# EasyEDA Pro project ProPrj_国赛底层板子_2026-05-31.epro, schematic Schematic1

## Sheets
1 P1: Board Name: Board1; Create Date: 2025-09-03; Page Name: P1; Project Name: 连接板; Schematic Name: Schematic1; Update Date: 2025-09-16; Company: 嘉立创EDA; Page Size: A4; Version: V1.0
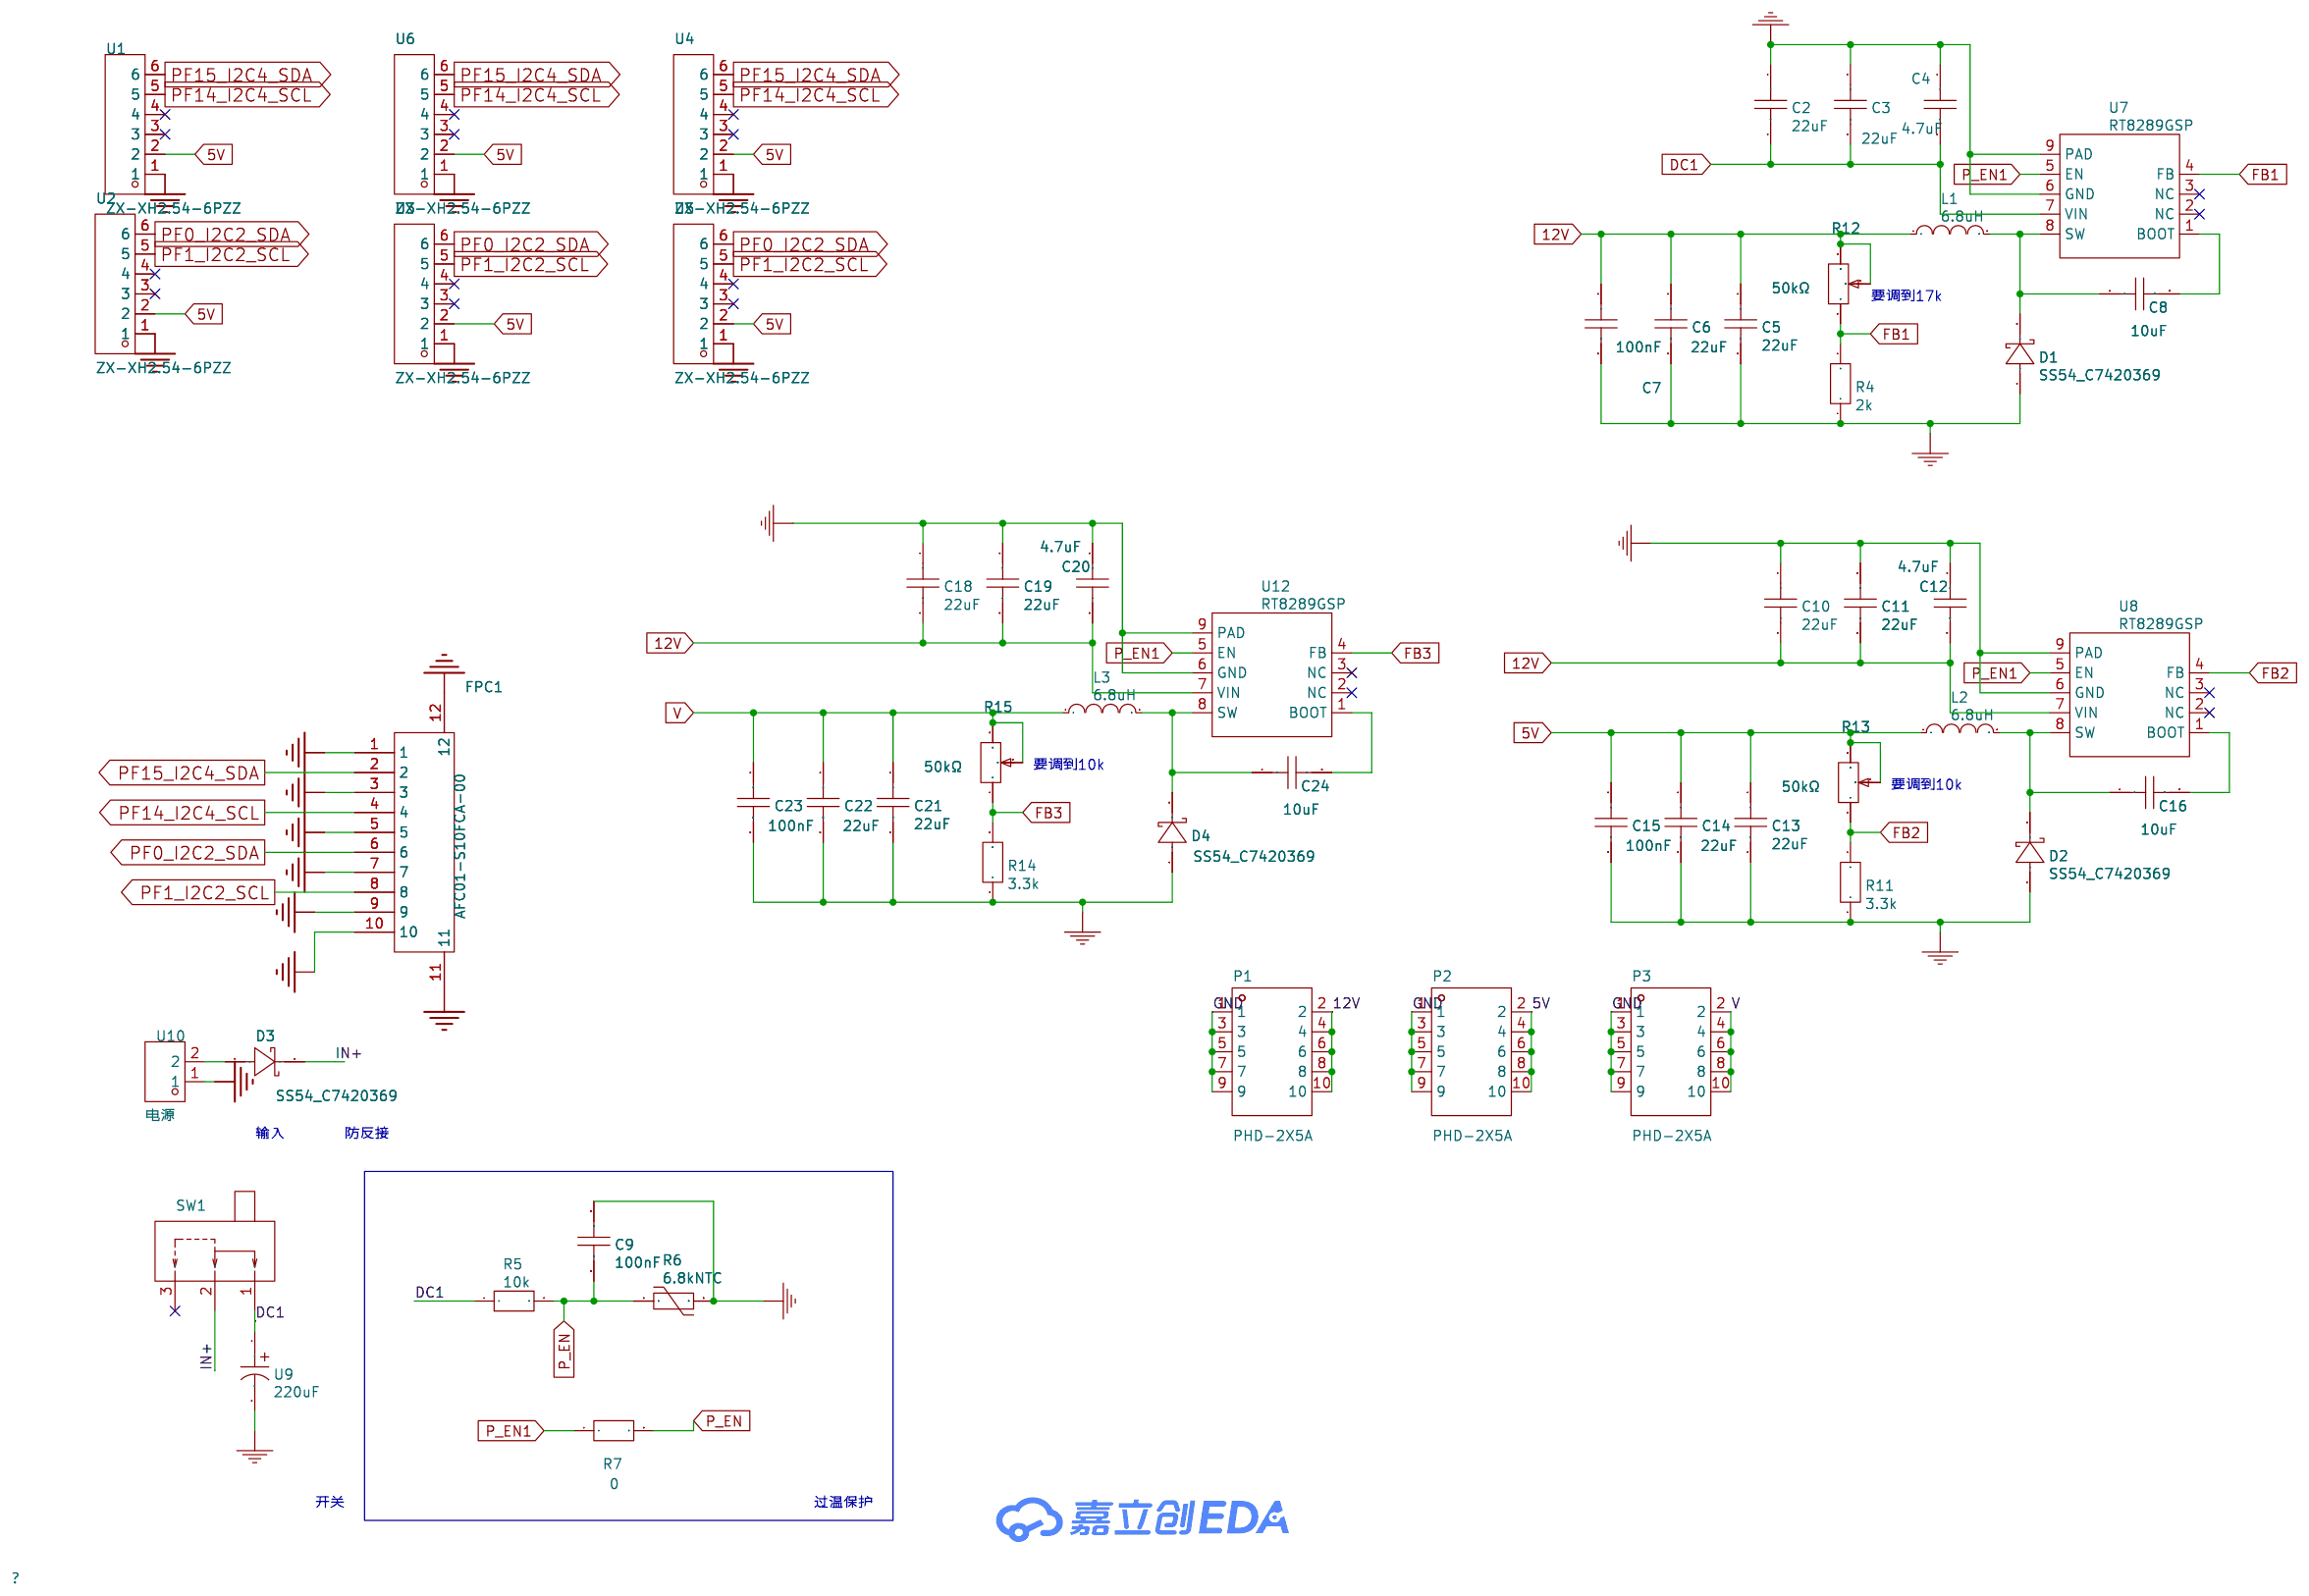
[diagram p0: P1]
2 P2: Page Name: P2; Update Date: 2025-09-03
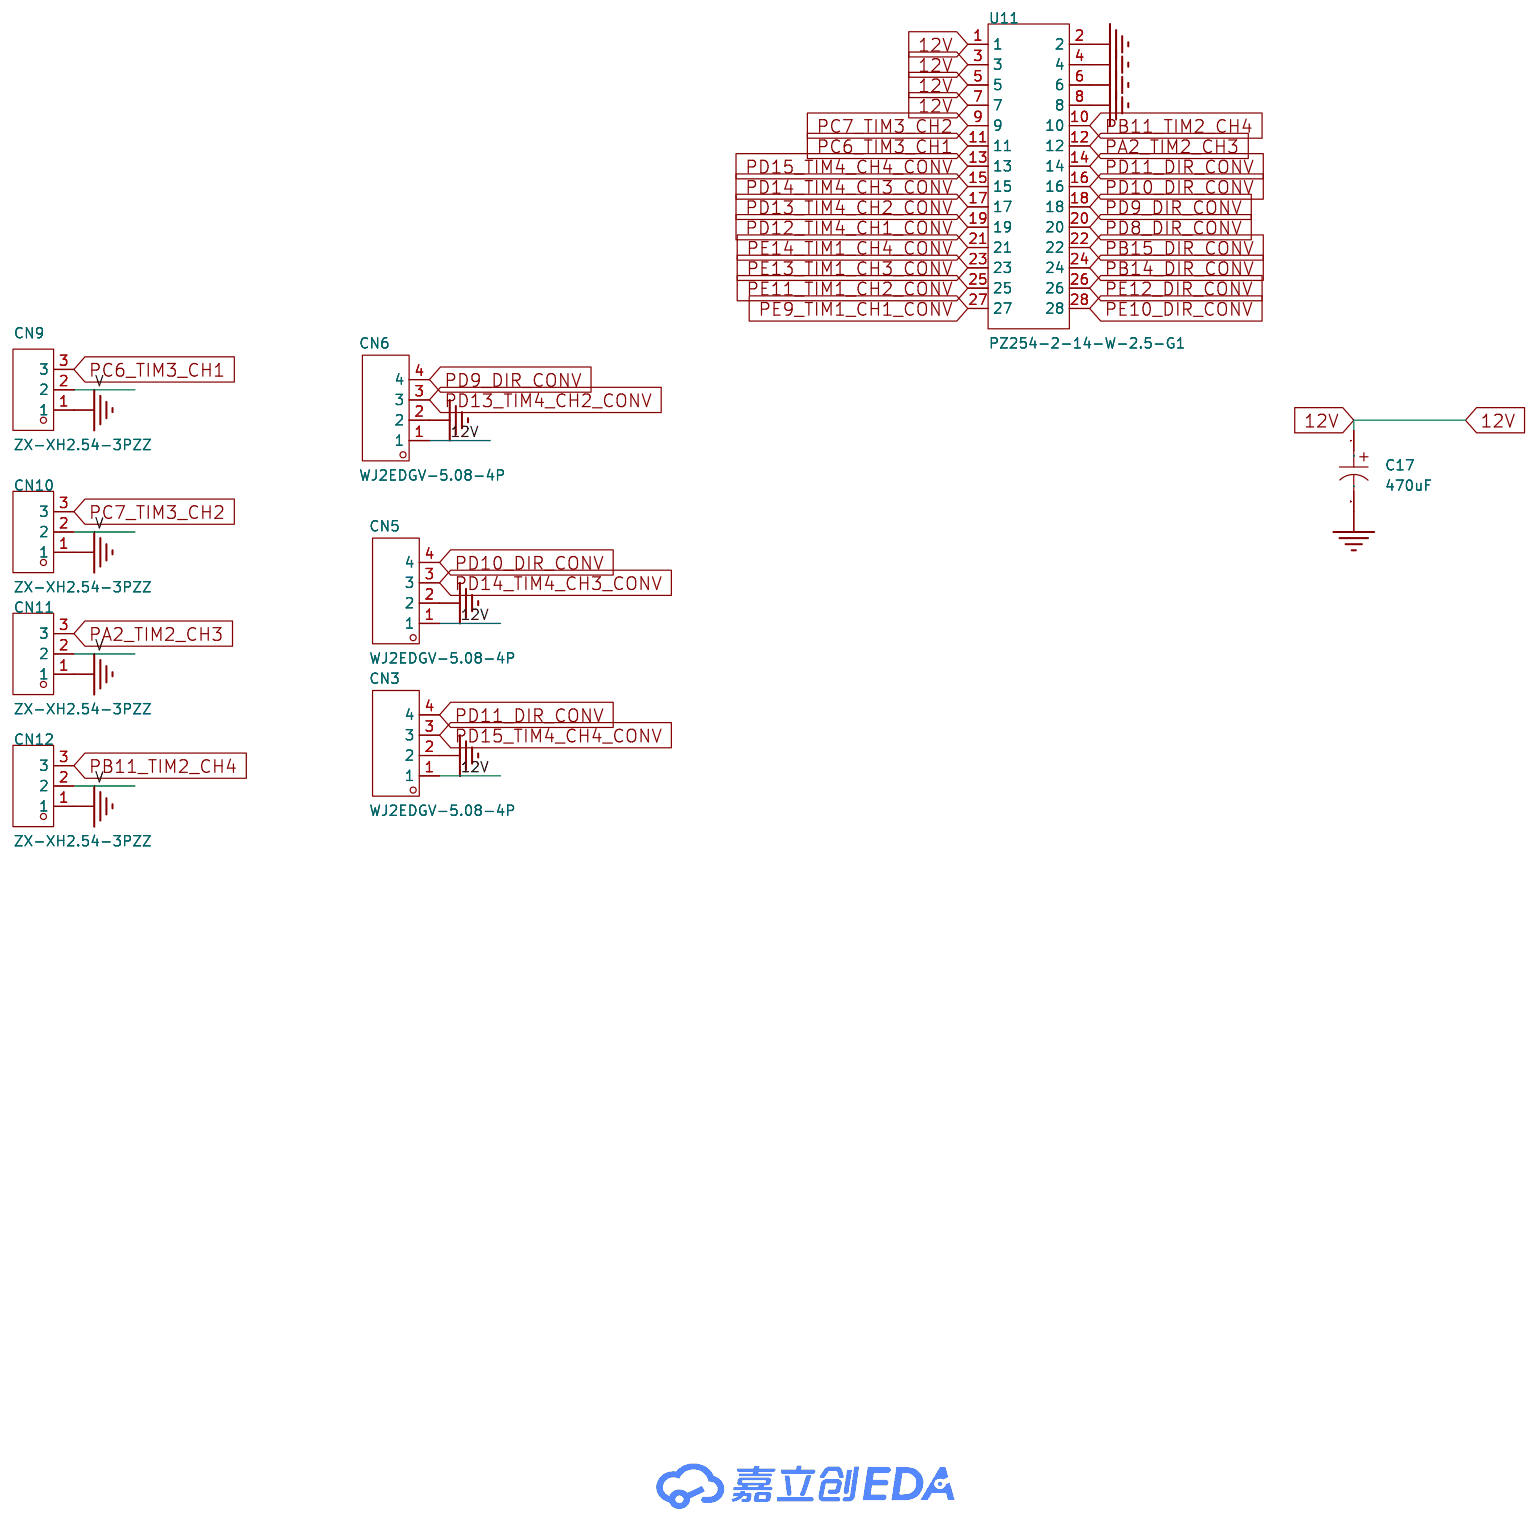
[diagram p1: P2]

## Parts
sheet P1
C2  22uF  [C0805]
C3  22uF  [C0805]
C4  4.7uF  [C0805]
C5  22uF  [C0805]
C6  22uF  [C0805]
C7  100nF  [C0805]
C8  10uF  [C0805]
C9  100nF  [C0805]
C10  22uF  [C0805]
C11  22uF  [C0805]
C12  4.7uF  [C0805]
C13  22uF  [C0805]
C14  22uF  [C0805]
C15  100nF  [C0805]
C16  10uF  [C0805]
C18  22uF  [C0805]
C19  22uF  [C0805]
C20  4.7uF  [C0805]
C21  22uF  [C0805]
C22  22uF  [C0805]
C23  100nF  [C0805]
C24  10uF  [C0805]
D1  SS54_C7420369  [SMA_L4.3-W2.6-LS5.0-FD]
D2  SS54_C7420369  [SMA_L4.3-W2.6-LS5.0-FD]
D3  SS54_C7420369  [SMA_L4.3-W2.6-LS5.0-FD]
D4  SS54_C7420369  [SMA_L4.3-W2.6-LS5.0-FD]
FPC1  AFC01-S10FCA-00  [FPC-SMD_P0.5-10P_FGS-XJ-H2.0]
L1  6.8uH  [IND-SMD_L7.0-W6.6]
L2  6.8uH  [IND-SMD_L7.0-W6.6]
L3  6.8uH  [IND-SMD_L7.0-W6.6]
P1  PHD-2X5A  [CONN-TH_10P-P2.00_PHD2.0MM-2X5]
P2  PHD-2X5A  [CONN-TH_10P-P2.00_PHD2.0MM-2X5]
P3  PHD-2X5A  [CONN-TH_10P-P2.00_PHD2.0MM-2X5]
R4  2k  [R0805]
R5  10k  [R0805]
R6  6.8kNTC  [R0805]
R7  0  [R0805]
R11  3.3k  [R0805]
R12  50kΩ  [RES-ADJ-TH_3296W]
R13  50kΩ  [RES-ADJ-TH_3296W]
R14  3.3k  [R0805]
R15  50kΩ  [RES-ADJ-TH_3296W]
SW1  KH-SS12D10-G9-3.5  [SW-TH_KH-SS12D10-G9-3.5]
U1  ZX-XH2.54-6PZZ  [CONN-TH_6P-P2.50_ZX-XH2.54-6PZZ]
U2  ZX-XH2.54-6PZZ  [CONN-TH_6P-P2.50_ZX-XH2.54-6PZZ]
U3  ZX-XH2.54-6PZZ  [CONN-TH_6P-P2.50_ZX-XH2.54-6PZZ]
U4  ZX-XH2.54-6PZZ  [CONN-TH_6P-P2.50_ZX-XH2.54-6PZZ]
U5  ZX-XH2.54-6PZZ  [CONN-TH_6P-P2.50_ZX-XH2.54-6PZZ]
U6  ZX-XH2.54-6PZZ  [CONN-TH_6P-P2.50_ZX-XH2.54-6PZZ]
U7  RT8289GSP  [SOIC-8_L5.0-W4.0-P1.27-LS6.0-BL-EP2.0]
U8  RT8289GSP  [SOIC-8_L5.0-W4.0-P1.27-LS6.0-BL-EP2.0]
U9  220uF  [CAP-SMD_BD6.3-L6.5-W6.5-LS7.2-FD]
U10  电源  [CONN-TH_P5.00_KF301-5.0-2P]
U12  RT8289GSP  [SOIC-8_L5.0-W4.0-P1.27-LS6.0-BL-EP2.0]
sheet P2
C17  470uF  [CAP-TH_BD8.0-P3.50-D0.5-FD]
CN3  WJ2EDGV-5.08-4P  [CONN-TH_4P-P5.08_WJ2EDGV-5.08-4P]
CN5  WJ2EDGV-5.08-4P  [CONN-TH_4P-P5.08_WJ2EDGV-5.08-4P]
CN6  WJ2EDGV-5.08-4P  [CONN-TH_4P-P5.08_WJ2EDGV-5.08-4P]
CN9  ZX-XH2.54-3PZZ  [CONN-TH_3P-P2.54_2501S-3P]
CN10  ZX-XH2.54-3PZZ  [CONN-TH_3P-P2.54_2501S-3P]
CN11  ZX-XH2.54-3PZZ  [CONN-TH_3P-P2.54_2501S-3P]
CN12  ZX-XH2.54-3PZZ  [CONN-TH_3P-P2.54_2501S-3P]
U11  PZ254-2-14-W-2.5-G1  [HDR-TH_28P-P2.54-H-M-R2-C14-S2.54]

## Library data of the parts
C2 C3 C5 C6 C10 C11 C13 C14 C18 C19 C21 C22 = 22uF_1: nameAlias: Value(F); Contributor: LCEDA_Lib; spicePre: C; spiceSymbolName: C_RAD-0.1_US
C4 C12 C20 = 4.7uF_1: nameAlias: Value(F); Contributor: LCEDA_Lib; spicePre: C; spiceSymbolName: C_RAD-0.1_US
C7 C9 C15 C23 = 100nF_1: nameAlias: Value(F); Contributor: LCEDA_Lib; spicePre: C; spiceSymbolName: C_RAD-0.1_US
C8 C16 C24 = 10uF_1: nameAlias: Value(F); Contributor: LCEDA_Lib; spicePre: C; spiceSymbolName: C_RAD-0.1_US
D1-D4 = SS54_C7420369_1: Supplier: LCSC; Supplier Part: C7420369; Manufacturer: 宏迦橙; Manufacturer Part: SS54; JLCPCB Part Class: Extended Part; Contributor: lcsc; spicePre: D
FPC1 = AFC01-S10FCA-00: 锁定特性:翻盖式;触点类型:下接;触点数量:10P;间距:0.5mm;安装类型:卧贴;; LCSC Part Name: 间距:0.5mm P数:10P 翻盖式 下接; Supplier Part: C262659; Manufacturer: JS(钜硕电子); Supplier Footprint: SMD,P=0.5mm,卧贴; JLCPCB Part Class: 扩展库; Datasheet: https://atta.szlcsc.com/upload/public/pdf/source/20190816/C413942_2A72D1AC756EAE17EEDF756A339D4500.pdf; Supplier: LCSC; Locking Feature: 翻盖式; Contact Type: 下接; Number of Contacts: 10P; Pitch: 0.5mm; Mounting Type: 卧贴; FFC, FCB Thickness: 0.3mm; Height Above Board: 2mm
L1-L3 = 6.8uH_1: Supplier: LCSC; Manufacturer: cjiang(长江微电); Manufacturer Part: FXL0630-6R8-M; Supplier Part: C167221; JLCPCB Part Class: Extended Part; nameAlias: Value; Contributor: LCSC; spicePre: L; spiceSymbolName: FXL0630-6R8-M
P1-P3 = PHD-2X5A: 参考系列:PHD;间距:2mm;插针结构:2x5P;排数:2;每排PIN数:5;行距:2mm;安装方式:-;触头材质:磷青铜;; LCSC Part Name: PHD2.0mm-2X5,10P，脚距2.0mm双排直针针座; Supplier Part: C49123; Manufacturer: BOOMELE(博穆精密); Supplier Footprint: 插件,P=2mm; JLCPCB Part Class: Extended Part; Datasheet: https://atta.szlcsc.com/upload/public/pdf/source/20151126/1457707588189.pdf; Supplier: LCSC; Reference Series: PHD; Pitch: 2mm; Pins Structure: 2x5P; Number of Rows: 2; Number of PINs Per Row: 5; Row Spacing: 2mm; Contact Material: 磷青铜
R4 R11 R14 = 3.3k_1: nameAlias: Value(Ω); Contributor: LCEDA_Lib; spicePre: R; spiceSymbolName: R_AXIAL-0.3_EU
R5 = 10k_2: nameAlias: Value(Ω); Contributor: LCEDA_Lib; spicePre: R; spiceSymbolName: R_AXIAL-0.3_EU
R6 = 6.8kNTC_1: Supplier: LCSC; Supplier Part: C338640; Manufacturer: FH(风华); Manufacturer Part: CMFB682J3950HANT; JLCPCB Part Class: Extended Part; nameAlias: Value; Contributor: LCSC; spicePre: R; spiceSymbolName: CMFB682J3950HANT
R7 = 0_1: nameAlias: Value(Ω); Contributor: LCEDA_Lib; spicePre: R; spiceSymbolName: R_AXIAL-0.3_EU
R12 R13 R15 = 3296W-1-104-8mm: 阻值:100kΩ;精度:±10%;; LCSC Part Name: 100kΩ ±10%; Supplier Part: C330435; Manufacturer: BOCHEN(博晨); Supplier Footprint: 插件; JLCPCB Part Class: 扩展库; Datasheet: https://atta.szlcsc.com/upload/public/pdf/source/20181127/C330435_7F54C1F28E27466BE6653300BC6FB0B7.pdf; Supplier: LCSC; Tolerance: ±10%
SW1 = KH-SS12D10-G9-3.5_1: Supplier: LCSC; Supplier Part: C5274458; Manufacturer: kinghelm(金航标); JLCPCB Part Class: Extended Part; Contributor: lcsc; spicePre: S
U1-U6 = ZX-XH2.54-6PZZ: 插针结构:1x6P;间距:2.5mm;安装方式:直插;参考系列:XH;总PIN数:6P;排数:1;每排PIN数:6;行距:-;额定电流:3A;触头材质:黄铜;触头镀层:锡;工作温度:-25℃~+85℃;; LCSC Part Name: 1x6P 间距:2.5mm 直插 系列:XH; Supplier Part: C7429636; Manufacturer: Megastar(兆星); Supplier Footprint: 插件,P=2.5mm; JLCPCB Part Class: 扩展库; Datasheet: https://atta.szlcsc.com/upload/public/pdf/source/20230619/1243AD0A516E39CD3D274D8985780568.pdf; Supplier: LCSC; Pins Structure: 1x6P; Pitch: 2.5mm; Mounting Type: 直插; Reference Series: XH; Number of Pins: 6P; Number of Rows: 1; Number of PINs Per Row: 6; Current Rating: 3A; Contact Material: 黄铜; Contact Plating: 锡; Operating Temperature: -25℃~+85℃; Voltage Rating: 250V; Plastic Material: PA66; Flame Retardant Rating: UL94V-0; Color: 白色; Z-Height of the Board: 7mm; X-Length of Bottom Edge on Board (Spacing Line): 17.5mm; Y-Width of Bottom Edge on Board: 5.9mm
U7 U8 U12 = RT8289GSP_1: Supplier: LCSC; Manufacturer: RICHTEK(立锜); Supplier Part: C39202; JLCPCB Part Class: Extended Part; spicePre: U
U9 = 220uF_1: Supplier: LCSC; Supplier Part: C22383611; Manufacturer: ACMECON(鼎容); Manufacturer Part: GVS1A227M0604CN; JLCPCB Part Class: Extended Part; nameAlias: Value; Contributor: lcsc; spicePre: U; spiceSymbolName: GVS1A227M0604CN
U10 = KF301-5.0-2P: 结构:1x2P;间距:5mm;颜色:蓝色;安装方式:直插;额定电流:17A;额定电压:250V;排数:1;线规 - AWG:14~22;线规 - 平方毫米:1.5;每排PIN数:2;工作温度范围:-30℃~+120℃;; LCSC Part Name: 5mm 1x2P 排数:1 每排P数:2 直插; Supplier Part: C474881; Manufacturer: KEFA(科发); Supplier Footprint: 插件,P=5mm; JLCPCB Part Class: 扩展库; Datasheet: https://atta.szlcsc.com/upload/public/pdf/source/20230317/03A5B5FC229D6F9225E8F51DA1A4E80A.pdf; Supplier: LCSC; Structure: 1x2P; Pitch: 5mm; Color: 蓝色; Mounting Style: 直插; Current Rating (Max): 17A; Voltage Rating (Max): 250V; Number of Pins: 2P; Number of Rows: 1; Wire Gauge - AWG: 14~22; Wire Gauge - mm2: 1.5; Number of PINs Per Row: 2; Operating Temperature Range: -30℃~+120℃
C17 = ERG35V470M8X16: 容值:470uF;精度:±20%;额定电压:35V;纹波电流:1.05A@100kHz;等效串联电阻(ESR):70mΩ@100kHz;; LCSC Part Name: 470uF ±20% 35V; Supplier Part: C48935388; Manufacturer: 捷而瑞; Supplier Footprint: 插件,D8xL16mm; JLCPCB Part Class: 扩展库; Datasheet: https://atta.szlcsc.com/upload/public/pdf/source/20250526/717B4C76834FE5C4A331D19A222D031C.pdf; Supplier: LCSC; Tolerance: ±20%; Voltage Rating: 35V; Ripple Current: 1.05A@100kHz; Equivalent Series Resistance(ESR): 70mΩ@100kHz; Pin Spacing: 3.5mm; Diameter: 8mm; Height - Seated (Max): 16mm; Lifetime: 2000hrs@105℃; Operating Temperature: -40℃~+105℃
CN3 CN5 CN6 = WJ2EDGV-5.08-4P: 连接器类型:板端/插座-开口;固定方式:-;结构:1x4P;间距:5.08mm;颜色:绿色;安装方式:直针;排数:1;每排PIN数:4;额定电流:20A;额定电压:450V;线规 - AWG:-;线规 - 平方毫米:-;触头材质:黄铜;触头镀层:锡;工作温度范围:-40℃~+105℃;焊接温度(最大值):-;; LCSC Part Name: 1x4P 5.08mm 排数:1 每排P数:4; Supplier Part: C8429; Manufacturer: KANGNEX(康奈克斯电气); Supplier Footprint: 插件,P=5.08mm; JLCPCB Part Class: 扩展库; Datasheet: https://atta.szlcsc.com/upload/public/pdf/source/20191225/C8429_2B66D25DFDD07B102A2AAB9ACF72222E.pdf; Supplier: LCSC; Connector Type: 板端/插座-开口; Structure: 1x4P; Pitch: 5.08mm; Color: 绿色; Mounting Style: 直针; Number of Pins: 4P; Number of Rows: 1; Number of PINs Per Row: 4; Current Rating (Max): 20A; Voltage Rating (Max): 450V; Contact Material: 黄铜; Contact Plating: 锡; Operating Temperature Range: -40℃~+105℃
CN9-CN12 = ZX-XH2.54-3PZZ: 插针结构:1x3P;间距:2.5mm;安装方式:直插;参考系列:XH;总PIN数:3P;排数:1;每排PIN数:3;行距:-;额定电流:3A;触头材质:黄铜;触头镀层:锡;工作温度:-25℃~+85℃;; LCSC Part Name: 1x3P 间距:2.5mm 直插 系列:XH; Supplier Part: C7429633; Manufacturer: Megastar(兆星); Supplier Footprint: 插件,P=2.5mm; JLCPCB Part Class: 扩展库; Datasheet: https://atta.szlcsc.com/upload/public/pdf/source/20230619/AE17037A2CFDBE8D9CBA775D61AD0A84.pdf; Supplier: LCSC; Pins Structure: 1x3P; Pitch: 2.5mm; Mounting Type: 直插; Reference Series: XH; Number of Pins: 3P; Number of Rows: 1; Number of PINs Per Row: 3; Current Rating: 3A; Contact Material: 黄铜; Contact Plating: 锡; Operating Temperature: -25℃~+85℃; Voltage Rating: 250V; Plastic Material: PA66; Flame Retardant Rating: UL94V-0; Color: 白色; Z-Height of the Board: 7mm; X-Length of Bottom Edge on Board (Spacing Line): 10mm; Y-Width of Bottom Edge on Board: 5.9mm
U11 = PZ254-2-14-W-2.5-G1: 插针结构:2x14P;间距:2.54mm;行距:2.54mm;圆针/方针:方针;安装方式:弯插;排数:双排;总PIN位数:28P;额定电流:3A;配合针长度:6mm;塑高:2.5mm;端接针长度:-;工作温度:-40℃~+105℃;颜色:黑色;; LCSC Part Name: 2x14P 间距:2.54mm 方针 弯插; Supplier Part: C18198028; Manufacturer: HCTL(华灿天禄); Supplier Footprint: 弯插,P=2.54mm; JLCPCB Part Class: Extended Part; Datasheet: https://atta.szlcsc.com/upload/public/pdf/source/20230921/EDF240DE1BFF70AE12D0E8E86FBA5889.pdf; Supplier: LCSC; Pin Structure: 2x14P; Pitch: 2.54mm; Row Spacing: 2.54mm; Circluar Pins/Square Pins: 方针; Mounting Type: 弯插; Number of Rows: 双排; Number of Pins: 28P; Current Rating: 3A; Length of Mating Pin: 6mm; Insulation Height: 2.5mm; Operating Temperature: -40℃~+105℃; Color: 黑色

## Nets
5V: C13.1 C14.1 C15.1 L2.1 P2.2 P2.4 P2.6 P2.8 P2.10 R13.2 R13.3 U1.2 U2.2 U3.2 U4.2 U5.2 U6.2
12V: C5.1 C6.1 C7.1 C10.2 C11.2 C12.2 C17.1 C18.2 C19.2 C20.2 CN3.1 CN5.1 CN6.1 L1.1 P1.2 P1.4 P1.6 P1.8 P1.10 R12.2 R12.3 U8.7(VIN) U11.1 U11.3 U11.5 U11.7 U12.7(VIN)
GND: C2.1 C3.1 C4.1 C5.2 C6.2 C7.2 C9.2 C10.1 C11.1 C12.1 C13.2 C14.2 C15.2 C17.2 C18.1 C19.1 C20.1 C21.2 C22.2 C23.2 CN3.2 CN5.2 CN6.2 CN9.1 CN10.1 CN11.1 CN12.1 D1.1(A) D2.1(A) D4.1(A) FPC1.1 FPC1.3 FPC1.5 FPC1.7 FPC1.9 FPC1.10 FPC1.11 FPC1.12 P1.1 P1.3 P1.5 P1.7 P1.9 P2.1 P2.3 P2.5 P2.7 P2.9 P3.1 P3.3 P3.5 P3.7 P3.9 R4.1 R6.2 R11.1 R14.1 U1.1 U2.1 U3.1 U4.1 U5.1 U6.1 U7.6(GND) U7.9(PAD) U8.6(GND) U8.9(PAD) U9.2 U10.1 U11.2 U11.4 U11.6 U11.8 U12.6(GND) U12.9(PAD)
DC1: C2.2 C3.2 C4.2 R5.1 SW1.1 U7.7(VIN) U9.1
FB1: R4.2 R12.1 U7.4(FB)
FB2: R11.2 R13.1 U8.4(FB)
FB3: R14.2 R15.1 U12.4(FB)
IN+: D3.2(K) SW1.2
P_EN: C9.1 R5.2 R6.1 R7.2
P_EN1: R7.1 U7.5(EN) U8.5(EN) U12.5(EN)
PA2_TIM2_CH3: CN11.3 U11.12
PB11_TIM2_CH4: CN12.3 U11.10
PB14_DIR_CONV: U11.24
PB15_DIR_CONV: U11.22
PC6_TIM3_CH1: CN9.3 U11.11
PC7_TIM3_CH2: CN10.3 U11.9
PD8_DIR_CONV: U11.20
PD9_DIR_CONV: CN6.4 U11.18
PD10_DIR_CONV: CN5.4 U11.16
PD11_DIR_CONV: CN3.4 U11.14
PD12_TIM4_CH1_CONV: U11.19
PD13_TIM4_CH2_CONV: CN6.3 U11.17
PD14_TIM4_CH3_CONV: CN5.3 U11.15
PD15_TIM4_CH4_CONV: CN3.3 U11.13
PE9_TIM1_CH1_CONV: U11.27
PE10_DIR_CONV: U11.28
PE11_TIM1_CH2_CONV: U11.25
PE12_DIR_CONV: U11.26
PE13_TIM1_CH3_CONV: U11.23
PE14_TIM1_CH4_CONV: U11.21
PF0_I2C2_SDA: FPC1.6 U2.6 U3.6 U5.6
PF1_I2C2_SCL: FPC1.8 U2.5 U3.5 U5.5
PF14_I2C4_SCL: FPC1.4 U1.5 U4.5 U6.5
PF15_I2C4_SDA: FPC1.2 U1.6 U4.6 U6.6
V: C21.1 C22.1 C23.1 CN9.2 CN10.2 CN11.2 CN12.2 L3.1 P3.2 P3.4 P3.6 P3.8 P3.10 R15.2 R15.3
$1N1402: C8.1 D1.2(K) L1.2 U7.8(SW)
$1N1403: C8.2 U7.1(BOOT)
$1N1889: C16.1 D2.2(K) L2.2 U8.8(SW)
$1N1890: C16.2 U8.1(BOOT)
$1N2276: D3.1(A) U10.2
$1N8259: C24.1 D4.2(K) L3.2 U12.8(SW)
$1N8260: C24.2 U12.1(BOOT)

Not connected (* = marked no-connect by the designer): SW1 3*; U1 3* 4*; U2 3* 4*; U3 3* 4*; U4 3* 4*; U5 3* 4*; U6 3* 4*; U7 2(NC)* 3(NC)*; U8 2(NC)* 3(NC)*; U12 2(NC)* 3(NC)*

## Notes on the sheets
sheet 1
- 要调到17k
- 要调到10k
- 要调到10k
- 输入
- 防反接
- 开关
- 过温保护
